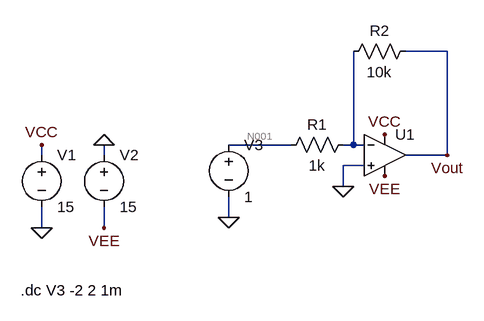
[diagram p0: schematic Draft2.asc]
Draft2.asc, the LTspice schematic file:
Version 4.1
SHEET 1 880 680
WIRE 528 -32 464 -32
WIRE 288 112 192 112
WIRE 384 112 384 -32
WIRE 384 112 368 112
WIRE 400 112 384 112
WIRE -96 128 -96 112
WIRE 0 128 0 112
WIRE 528 128 528 -32
WIRE 528 128 464 128
WIRE 400 144 368 144
WIRE 368 176 368 144
WIRE 192 224 192 192
WIRE -96 240 -96 208
WIRE 0 240 0 208
FLAG -96 112 VCC
FLAG 0 240 VEE
FLAG -96 240 0
FLAG 0 112 0
FLAG 432 96 VCC
FLAG 432 160 VEE
FLAG 368 176 0
FLAG 528 128 Vout
FLAG 192 224 0
SYMBOL OpAmps\\UniversalOpAmp2 432 128 R0
SYMATTR InstName U1
SYMATTR Value2 Avol=1Meg GBW=1.5Meg Slew=500k
SYMATTR SpiceLine Ilimit=25m Rail=1.5 Vos=0
SYMBOL voltage -96 112 R0
WINDOW 123 0 0 Left 0
WINDOW 39 0 0 Left 0
SYMATTR InstName V1
SYMATTR Value 15
SYMBOL voltage 0 112 R0
WINDOW 123 0 0 Left 0
WINDOW 39 0 0 Left 0
SYMATTR InstName V2
SYMATTR Value 15
SYMBOL res 384 96 R90
WINDOW 0 0 56 VBottom 2
WINDOW 3 32 56 VTop 2
SYMATTR InstName R1
SYMATTR Value 1k
SYMBOL res 480 -48 R90
WINDOW 0 0 56 VBottom 2
WINDOW 3 32 56 VTop 2
SYMATTR InstName R2
SYMATTR Value 10k
SYMBOL voltage 192 96 R0
WINDOW 123 0 0 Left 0
WINDOW 39 0 0 Left 0
SYMATTR InstName V3
SYMATTR Value 1
TEXT -128 336 Left 2 !.dc V3 -2 2 1m

The netlist it stands for:
* Draft2.asc
X§U1 0 N002 VCC VEE Vout level2 Avol=1Meg GBW=1.5Meg Slew=500k Ilimit=25m Rail=1.5 Vos=0 En=0 Enk=0 In=0 Ink=0 Rin=500Meg  ; pins In+ In- V+ V- OUT
V1 VCC 0 15
V2 0 VEE 15
R1 N002 N001 1k
R2 Vout N002 10k
V3 N001 0 1
.dc V3 -2 2 1m
.lib UniversalOpAmp2.lib
.backanno
.end

* Results of the author's LTspice run, read from the files saved beside the schematic
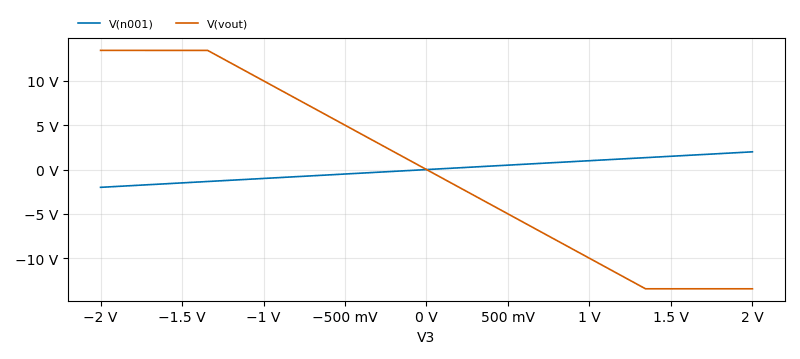
[diagram p1: DC transfer characteristic of Draft2.asc, plotted from the saved traces]
* DC transfer characteristic, 1 run:
*   V(n001): -2 V at V3=-2 V, 2 V at V3=2 V, min -2 V, max 2 V
*   V(vout): 13.43 V at V3=-2 V, -13.43 V at V3=2 V, min -13.43 V, max 13.43 V